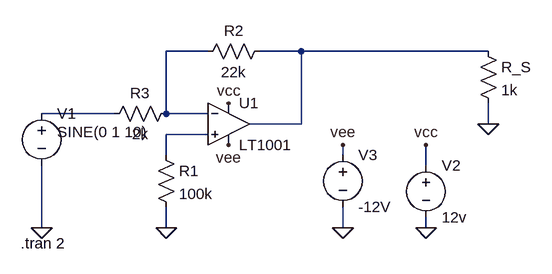
[diagram p0: schematic inv.asc]
inv.asc, the LTspice schematic file:
Version 4
SHEET 1 880 680
WIRE 176 48 112 48
WIRE 320 48 256 48
WIRE 608 48 320 48
WIRE 32 144 -80 144
WIRE 112 144 112 48
WIRE 176 144 112 144
WIRE 320 160 320 48
WIRE 320 160 240 160
WIRE 608 160 608 128
WIRE 176 176 112 176
WIRE 112 208 112 176
WIRE 384 208 384 192
WIRE 512 224 512 192
WIRE -80 320 -80 224
WIRE 112 320 112 288
WIRE 384 320 384 288
WIRE 512 320 512 304
FLAG 112 320 0
FLAG -80 320 0
FLAG 512 320 0
FLAG 384 320 0
FLAG 608 160 0
FLAG 384 192 vee
FLAG 208 128 vcc
FLAG 512 192 vcc
FLAG 208 192 vee
SYMBOL Opamps\\LT1001 208 96 R0
SYMATTR InstName U1
SYMBOL res 96 192 R0
SYMATTR InstName R1
SYMATTR Value 100k
SYMBOL res 272 32 R90
WINDOW 0 0 56 VBottom 2
WINDOW 3 32 56 VTop 2
SYMATTR InstName R2
SYMATTR Value 22k
SYMBOL res 128 128 R90
WINDOW 0 0 56 VBottom 2
WINDOW 3 32 56 VTop 2
SYMATTR InstName R3
SYMATTR Value 2k
SYMBOL voltage -80 128 R0
WINDOW 123 0 0 Left 2
WINDOW 39 0 0 Left 2
WINDOW 3 24 44 Left 2
SYMATTR InstName V1
SYMATTR Value SINE(0 1 10)
SYMBOL voltage 512 208 R0
WINDOW 123 0 0 Left 2
WINDOW 39 0 0 Left 2
SYMATTR InstName V2
SYMATTR Value 12v
SYMBOL voltage 384 192 R0
WINDOW 123 0 0 Left 2
WINDOW 39 0 0 Left 2
SYMATTR InstName V3
SYMATTR Value -12V
SYMBOL res 592 32 R0
SYMATTR InstName R_S
SYMATTR Value 1k
TEXT -112 344 Left 2 !.tran 2

The netlist it stands for:
* inv.asc
XU1 N004 N001 vcc vee N002 LT1001  ; pins In+ In- V+ V- OUT
R1 N004 0 100k
R2 N002 N001 22k
R3 N001 N003 2k
V1 N003 0 SINE(0 1 10)
V2 vcc 0 12v
V3 vee 0 -12V
R_S N002 0 1k
.tran 2
.lib LTC.lib
.backanno
.end